# Altium schematic sheet 1原理图.SchDoc
size A3
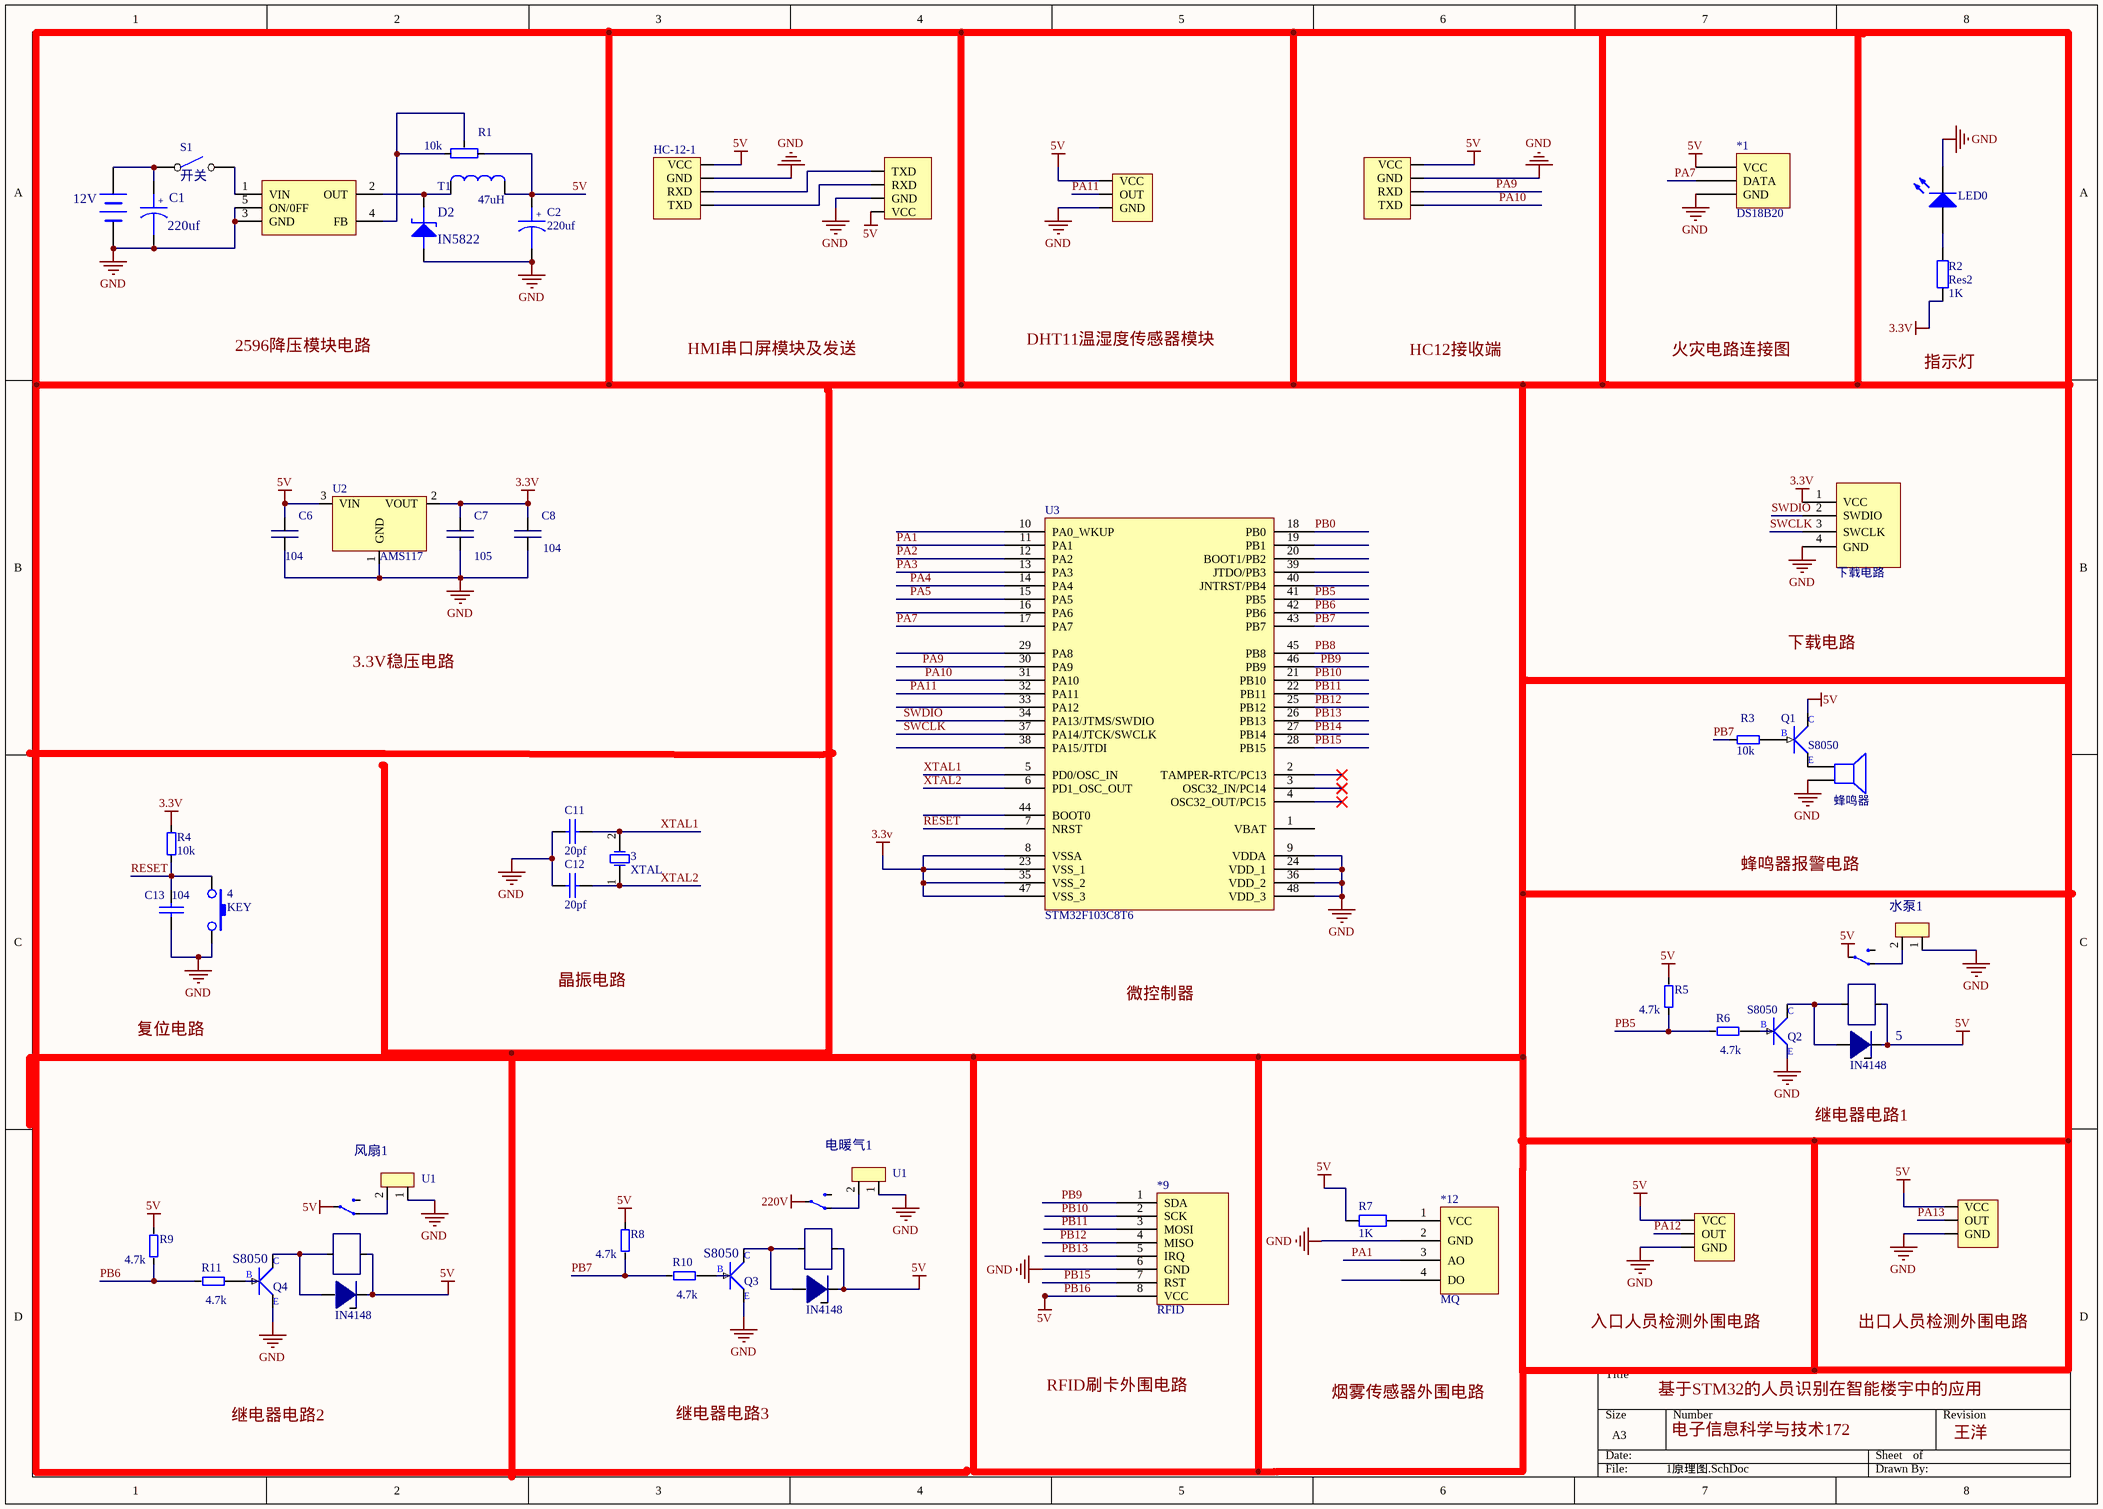
[diagram p0: 1原理图.SchDoc]

## Parts
1  2596降压模块  [8-8LED点阵 - duplicate]  (value not drawn)
3  XTAL  [XTAL]
4  KEY
5  继电器  (value not drawn)
12V  BATTERY  (value not drawn)
*  下载电路
*1  DS18B20
*2  CON2_1  (value not drawn)
*3  HC-12-1
*4  hc12  (value not drawn)
*5  hc12  (value not drawn)
*8  IN4148  [0805_LED_1]
*9  RFID
*10  CON2_1  (value not drawn)
*11  CON2_1  (value not drawn)
*12  MQ
*13  IN4148  [0805_LED_1]
*14  IN4148  [0805_LED_1]
C1  220uf
C2  220uf
C6  104  [0805-RES-CAP]
C7  105  [0805-RES-CAP]
C8  104  [0805-RES-CAP]
C11  20pf  [RAD0.1]
C12  20pf  [RAD0.1]
C13  104  [RAD0.1]
D1  LED0  [LED-0]
D2  IN5822
Q1  S8050
Q2  S8050
Q3  S8050
Q4  S8050
R1  10k  [VR]
R2  Res2  value 1K  [AXIAL-0.4]
R3  10k  [R标准]
R4  10k  [R标准]
R5  4.7k  [R标准]
R6  4.7k  [R标准]
R7  1K  [R 0805_L]
R8  4.7k  [R标准]
R9  4.7k  [R标准]
R10  4.7k  [R标准]
R11  4.7k  [R标准]
S1  开关
T1  47uH
U2  AMS117  [SOT-223]
U3  STM32F103C8T6
水泵1  CON2  (value not drawn)
电暖气1  U1
继电器1  继电器  (value not drawn)
继电器2  继电器  (value not drawn)
蜂鸣器1  蜂鸣器
风扇1  U1

## Nets
3.3V: *.1(VCC) C7.2 C8.2 R2.1 R4.2 U2.2(VOUT) U3.8(VSSA) U3.23(VSS_1) U3.35(VSS_2) U3.47(VSS_3)
5V: 5.1 *1.54(VCC) *2.1(VCC) *3.1(VCC) *4.1(VCC) *5.1(VCC) *8.2 *9.8(VCC) *10.1(VCC) *11.1(VCC) *13.2 *14.2 C2.1 C6.2 Q1.2 R1.1 R5.2 R7.2 R8.2 R9.2 T1.3 U2.3(VIN) 继电器1.1 继电器2.1  [also labelled PB16]
220V: 继电器1.1
GND: 1.3(GND) 1.5(ON/0FF) 4.2 12V.2(-) *.4(GND) *1.?2(GND) *2.3(GND) *3.1(GND) *4.1(GND) *5.1(GND) *9.6(GND) *10.3(GND) *11.3(GND) *12.2(GND) C1.2 C2.2 C6.1 C7.1 C8.1 C11.1 C12.2 C13.2 D1.2(K) D2.1(A) Q2.3 U2.1(GND) U3.9(VDDA) U3.24(VDD_1) U3.36(VDD_2) U3.48(VDD_3) 水泵1.1 电暖气1.1 蜂鸣器1.2 风扇1.1
PA1: *12.3(AO) U3.11(PA1)
PA2: U3.12(PA2)
PA3: U3.13(PA3)
PA4: U3.14(PA4)
PA5: U3.15(PA5)
PA7: *1.?1(DATA) U3.17(PA7)
PA9: *5.2(RXD) U3.30(PA9)
PA10: *5.3(TXD) U3.31(PA10)
PA11: *2.2(OUT) U3.32(PA11)
PA12: *11.2(OUT)
PA13: *10.2(OUT)
PB0: U3.18(PB0)
PB5: R5.1 R6.1 U3.41(PB5)
PB6: R9.1 R11.1 U3.42(PB6)
PB7: R3.1 R8.1 R10.1 U3.43(PB7)
PB8: U3.45(PB8)
PB9: *9.1(SDA) U3.46(PB9)
PB10: *9.2(SCK) U3.21(PB10)
PB11: *9.3(MOSI) U3.22(PB11)
PB12: *9.4(MISO) U3.25(PB12)
PB13: *9.5(IRQ) U3.26(PB13)
PB14: U3.27(PB14)
PB15: *9.7(RST) U3.28(PB15)
RESET: 4.1 C13.1 R4.1 U3.7(NRST)
SWCLK: *.3(SWCLK) U3.37(PA14/JTCK/SWCLK)
SWDIO: *.2(SWDIO) U3.34(PA13/JTMS/SWDIO)
XTAL1: 3.2 C11.2 U3.5(PD0/OSC_IN)
XTAL2: 3.1 C12.1 U3.6(PD1_OSC_OUT)
Net1_1: 1.1(VIN) S1.2
Net1_2: 1.2(OUT) D2.2(K) T1.1
Net1_4: 1.4(FB) R1.2 R1.3
Net5_1: 5.1 *8.1 Q2.2
Net5_1: 5.1 水泵1.2  [a separate net that carries the same name]
Net12V_1: 12V.1(+) C1.1 S1.1
Net*3_2: *3.2(RXD) *4.3(TXD)
Net*3_3: *3.3(TXD) *4.2(RXD)
Net*12_1: *12.1(VCC) R7.1
Net*13_1: *13.1 Q3.2 继电器1.1
Net*14_1: *14.1 Q4.2 继电器2.1
NetD1_1: D1.1(A) R2.2
NetQ1_1: Q1.1(G) R3.2
NetQ2_1: Q2.1(G) R6.2
NetQ3_1: Q3.1(G) R10.2
NetQ4_1: Q4.1(G) R11.2
Net电暖气1_2: 电暖气1.2 继电器1.1
Net继电器2_1: 继电器2.1 风扇1.2

Not connected (* = marked no-connect by the designer): *12 4(DO); Q1 3; Q3 3; Q4 3; U3 1(VBAT) 2(TAMPER-RTC/PC13)* 3(OSC32_IN/PC14)* 4(OSC32_OUT/PC15)* 10(PA0_WKUP) 16(PA6) 19(PB1) 20(BOOT1/PB2) 29(PA8) 33(PA12) 38(PA15/JTDI) 39(JTDO/PB3) 40(JNTRST/PB4) 44(BOOT0); 蜂鸣器1 1

## Notes on the sheet
- Labels drawn without touching a wire or pin: 3.3V稳压电路, 2596降压模块电路, DHT11温湿度传感器模块, HC12接收端, HMI串口屏模块及发送, RFID刷卡外围电路, 下载电路, 入口人员检测外围电路, 出口人员检测外围电路, 基于STM32的人员识别在智能楼宇中的应用, 复位电路, 微控制器, 指示灯, 晶振电路, 火灾电路连接图, 烟雾传感器外围电路, 王洋, 电子信息科学与技术172, 继电器电路1, 继电器电路2, 继电器电路3, 蜂鸣器报警电路
- (in symbol S8050) C; B; E
- (in symbol 电解电容) +

## Library data of the parts
1 = 2596降压模块: 8-8: RAD
3 = XTAL: XTAL: 12MHZ
*3 = hc12
*8 *13 *14 = LED
C1 C2 = 电解电容: Capacitor
C6-C8 = CAP
C11-C13 = 普通电容: Capacitor
D1 = LED0: Typical INFRARED GaAs LED; Published: 8-Jun-2000; LatestRevisionDate: 08-Jul-2005; LatestRevisionNote: Mech Layer 1 removed.; PackageReference: LED-0; Publisher: Altium Limited; PackageDescription: LED; 2 Leads
D2 = ZENER2: Zener Diode
R1 = 可调电阻: Potentiometer
R2 = Res2: Resistor; Published: 8-Jun-2000; LatestRevisionDate: 17-Jul-2002; LatestRevisionNote: Re-released for DXP Platform.; PackageReference: AXIAL-0.4; Publisher: Altium Limited; PackageDescription: Axial Device, Thru-Hole; 2 Leads; 0.4 in Pin Spacing
R3-R6 R8-R11 = RES
R7 = R: 贴片电阻; 版权归属: 源创客; BOM名称: 贴片电阻; 学习资源: www.ooocke.com
S1 = 单刀开关
T1 = TRANS3_1
U2 = LM1117-3.3_1
电暖气1 风扇1 = CON2